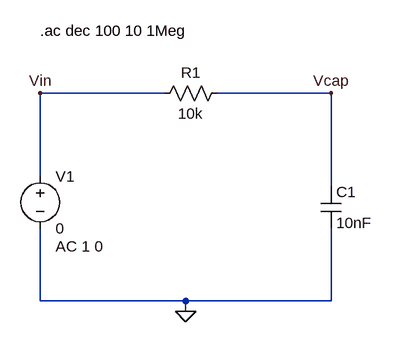
[diagram p0: schematic W01_D07_RC_LowPass_Filter.asc]
W01_D07_RC_LowPass_Filter.asc, the LTspice schematic file:
Version 4.1
SHEET 1 880 680
WIRE 256 -32 64 -32
WIRE 512 -32 336 -32
WIRE 64 96 64 -32
WIRE 512 112 512 -32
WIRE 64 288 64 176
WIRE 288 288 64 288
WIRE 512 288 512 176
WIRE 512 288 288 288
WIRE 288 304 288 288
FLAG 288 304 0
FLAG 512 -32 Vcap
FLAG 64 -32 Vin
SYMBOL voltage 64 80 R0
WINDOW 123 24 124 Left 2
WINDOW 39 0 0 Left 0
SYMATTR InstName V1
SYMATTR Value 0
SYMATTR Value2 AC 1 0
SYMBOL res 352 -48 R90
WINDOW 0 0 56 VBottom 2
WINDOW 3 32 56 VTop 2
SYMATTR InstName R1
SYMATTR Value 10k
SYMBOL cap 496 112 R0
SYMATTR InstName C1
SYMATTR Value 10nF
TEXT 64 -128 Left 2 !.ac dec 100 10 1Meg

The netlist it stands for:
* W01_D07_RC_LowPass_Filter.asc
V1 Vin 0 0 AC 1 0
R1 Vcap Vin 10k
C1 Vcap 0 10nF
.ac dec 100 10 1Meg
.backanno
.end